# Altium project Owens Test Node.PrjPcb
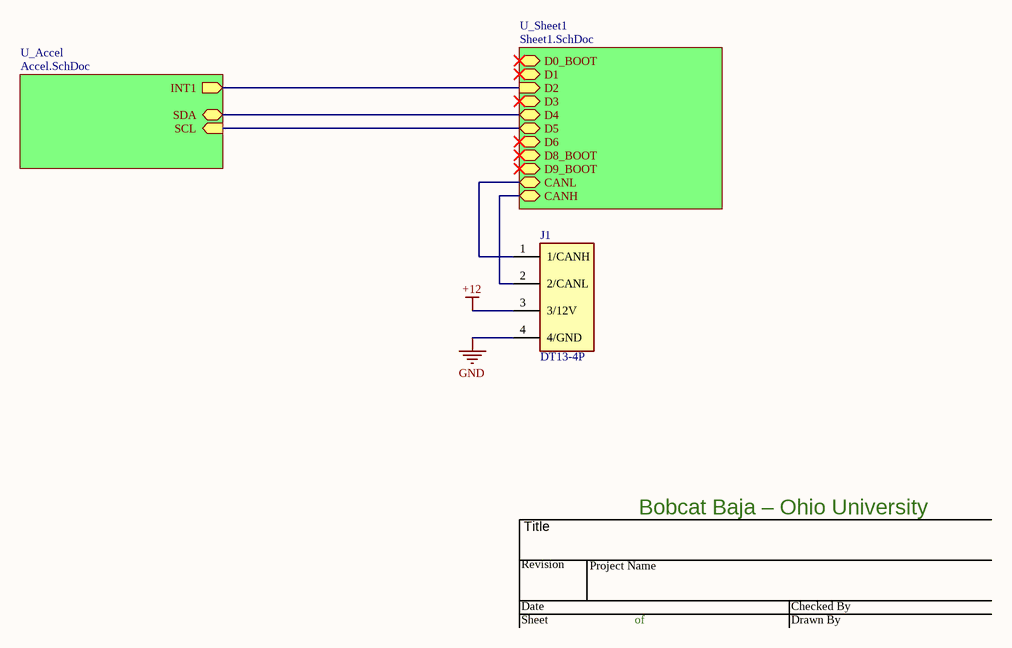
[diagram p0: Owens Test Node.SchDoc]
Title: Owens Test Accelerometer; Revision: A; DrawnBy: Owen Kennedy; CheckedBy: Toph Jones
3 sheets, 21 parts. Net scope: hierarchical (ports join the sheet entries above them; power ports are global).
Board file: Owens Test Node.PcbDoc
Sheets:
  Owens Test Node.SchDoc
    U_Accel = Accel.SchDoc
    U_Sheet1 = Sheet1.SchDoc

## Sheet Owens Test Node.SchDoc: Owens Test Accelerometer
size A; SheetNumber: 1; SheetTotal: 3

### Parts
J1  DT13-4P  [TE_DT13-4P]

### Sub-sheets
U_Accel = Accel.SchDoc: INT1 (out), SDA (bidir), SCL (in)
U_Sheet1 = Sheet1.SchDoc: D0_BOOT (bidir), D1 (bidir), D2 (in), D3 (bidir), D4 (bidir), D5 (bidir), D6 (bidir), D8_BOOT (bidir), D9_BOOT (bidir), CANL (bidir), CANH (bidir)

### Nets
+12: J1.3(3/12V)
GND: J1.4(4/GND)
CANH: J1.2(2/CANL) ; sheet U_Sheet1/CANH
CANL: J1.1(1/CANH) ; sheet U_Sheet1/CANL
SCL: sheet U_Accel/SCL, sheet U_Sheet1/D5
SDA: sheet U_Accel/SDA, sheet U_Sheet1/D4
NetU3_3: sheet U_Accel/INT1, sheet U_Sheet1/D2

### Notes on the sheet
- Title
- Bobcat Baja – Ohio University
- Revision
- Date
- Project Name
- Checked By
- Sheet
- of
- Drawn By

### Library data of the parts
J1 = CMP-002-00095-3: DT13 Series 4.44mm Pitch 4 Way 2 Row Right Angle PCB Header Solder Termination; MF: TE Connectivity; Design Item ID: DT13-4P; EU_RoHS_Compliance: Compliant; SnapEDA_Link: https://www.snapeda.com/parts/DT13-4P/TE+Connectivity+%252F+DEUTSCH/view-part/?ref=snap; Check_prices: https://www.snapeda.com/parts/DT13-4P/TE+Connectivity+%252F+DEUTSCH/view-part/?ref=eda; Component Type: Standard; MP: DT13-4P; Pins: 4; Source: DT13-4P.SchLib; Case/Package: None; Value: *

## Sheet Accel.SchDoc: Owens Test Accelerometer
size A; SheetNumber: 3; SheetTotal: 3
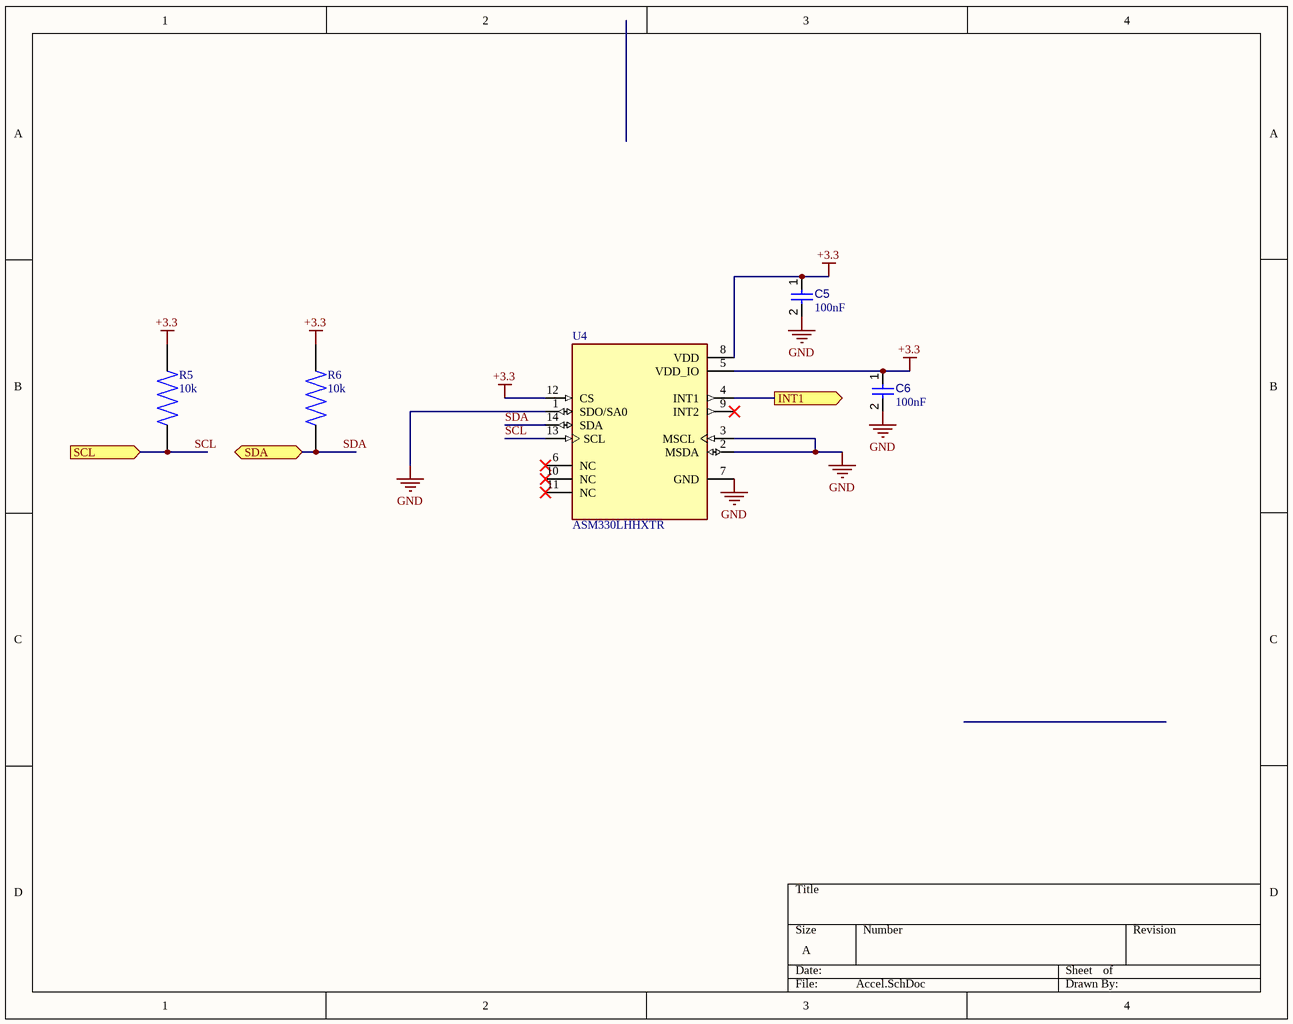
[diagram p1: Accel.SchDoc]

### Parts
C5  value 100nF  [KEMT-1206-2_L]  (hidden comment: C1206C104K5RACTU)
C6  value 100nF  [KEMT-1206-2_L]  (hidden comment: C1206C104K5RACTU)
R5  value 10k  [RESC3116X65N]  (hidden comment: RCS120610K0FKEA)
R6  value 10k  [RESC3116X65N]  (hidden comment: RCS120610K0FKEA)
U4  ASM330LHHXTR  [XDCR_ASM330LHHXTR]

### Ports
INT1 (out), SCL (in), SDA (bidir)

### Nets
+3.3: C5.1 C6.1 R5.2 R6.2 U4.5(VDD_IO) U4.8(VDD) U4.12(CS)
GND: C5.2 C6.2 U4.1(SDO/SA0) U4.2(MSDA) U4.3(MSCL) U4.7(GND)
SCL: R5.1 U4.13(SCL) ; port SCL
SDA: R6.1 U4.14(SDA) ; port SDA
NetU3_3: U4.4(INT1) ; port INT1

Not connected (* = marked no-connect by the designer): U4 6(NC)* 9(INT2)* 10(NC)* 11(NC)*

### Library data of the parts
C5 C6 = CMP-001-00131-1: Multilayer Ceramic Capacitors MLCC – SMD/SMT; KEMET; C1206C104K5RACTU; 100 nF; 1206; 50 V; 50 V; Tolerance: 10%; Voltage Rating: 50V; Case/Package: 1206; Max Operating Temperature: 125°C; Min Operating Temperature: -55°C; Pins: 2; Mounting Technology: Surface Mount
R5 R6 = CMP-009-00195-1: 10 kOhms Â±1% 0.5W, 1/2W Chip Resistor 1206 (3216 Metric) Automotive AEC-Q200, Pulse Withstanding Thick Film; MF: Vishay Dale; Design Item ID: RCS120610K0FKEA; Case/Package: 3116 Vishay; Check_prices: https://www.snapeda.com/parts/RCS120610K0FKEA/Vishay+Dale/view-part/?ref=eda; Source: RCS120610K0FKEA.SchLib; Pins: 2; MP: RCS120610K0FKEA; Component Type: Standard; SnapEDA_Link: https://www.snapeda.com/parts/RCS120610K0FKEA/Vishay+Dale/view-part/?ref=snap
U4 = CMP-522-000000-1: Accelerometer, Gyroscope, Temperature, 6 Axis Sensor IÂ²C, I3Câ„ , SPI Output; MF: STMicroelectronics; Source: ASM330LHHXTR.SchLib; Component Type: Standard; SnapEDA_Link: https://www.snapeda.com/parts/ASM330LHHXTR/STMicroelectronics/view-part/?ref=snap; Package: VFLGA-14 STMicroelectronics; Value: *; Pin Count: 14; Design Item ID: ASM330LHHXTR; MP: ASM330LHHXTR; Check_prices: https://www.snapeda.com/parts/ASM330LHHXTR/STMicroelectronics/view-part/?ref=eda

## Sheet Sheet1.SchDoc: Owens Test Accelerometer
size A; SheetNumber: 2; SheetTotal: 3
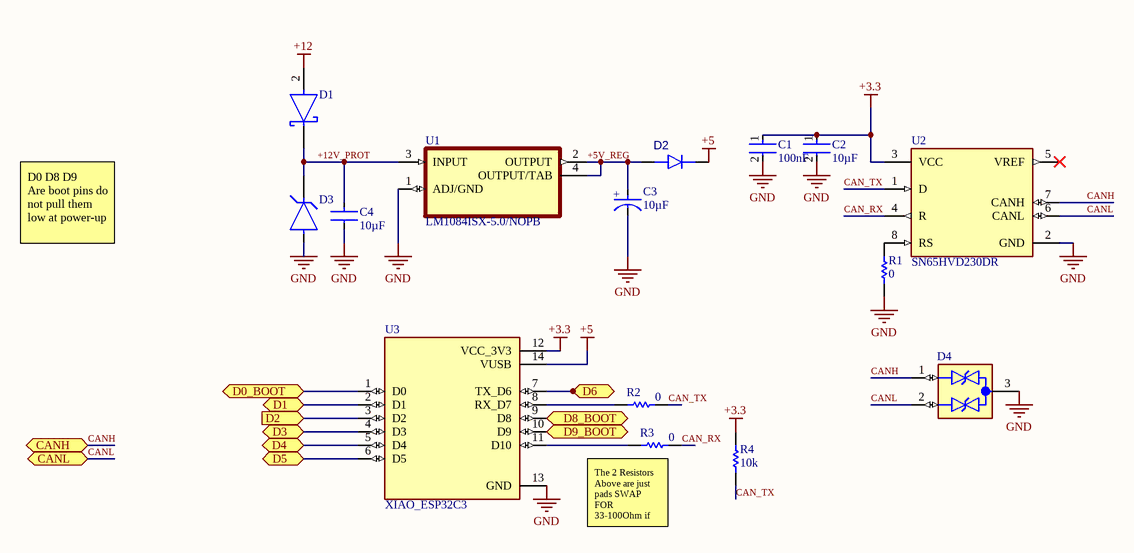
[diagram p2: Sheet1.SchDoc]

### Parts
C1  value 100nF  [FP-C0805C-DN-IPC_A]  (hidden comment: C0805C104K5RACTU)
C2  value 10µF  [FP-CGA4J-IPC_A]  (hidden comment: CGA4J1X7S1E106K125AE)
C3  value 10µF  [FP-T491A106K016AT-MFG]  (hidden comment: T491A106K016AT)
C4  value 10µF  [FP-CGA4J-IPC_A]  (hidden comment: CGA4J1X7S1E106K125AE)
D1  B340A-13-F  [FP-SMA-MFG]  (value not drawn)
D2  1N5819HW-7-F  [FP-SOD123-IPC_C]  (value not drawn)
D3  SMBJ15A  [FP-SMBJ-MFG]  (value not drawn)
D4  ESD2CAN24DBZRQ1  [SOT95P237X112-3N]  (value not drawn)
R1  value 0  [RESC2013X60X35ML10T20]  (hidden comment: Resistor 0R +/- 5% 0805 125 mW)
R2  value 0  [RESC2013X60X35ML10T20]  (hidden comment: Resistor 0R +/- 5% 0805 125 mW)
R3  value 0  [RESC2013X60X35ML10T20]  (hidden comment: Resistor 0R +/- 5% 0805 125 mW)
R4  value 10k  [RESC2013X60X35LL10T20]  (hidden comment: RC0805FR-0710KL)
U1  LM1084ISX-5.0/NOPB  [TO254P1524X483-4N]
U2  SN65HVD230DR  [FP-D0008A-IPC_B]
U3  XIAO_ESP32C3  [MODULE_XIAO_ESP32C3]

### Ports
CANH (bidir), CANL (bidir), D0_BOOT (bidir), D1 (bidir), D2 (in), D3 (bidir), D4 (bidir), D5 (bidir), D6 (bidir), D8_BOOT (bidir), D9_BOOT (bidir)

### Nets
+3.3: C1.1 C2.1 R4.2 U2.3(VCC) U3.12(VCC_3V3)
+5: D2.1(K) U3.14(VUSB)
+12: D1.2(A)
GND: C1.2 C2.2 C3.1(C) C4.2 D3.2(A) D4.3(GND) R1.1 U1.1(ADJ/GND) U2.2(GND) U3.13(GND)
+5V_REG: C3.2(A) D2.2(A) U1.2(OUTPUT) U1.4(OUTPUT/TAB)
+12V_PROT: C4.1 D1.1(C) D3.1(C) U1.3(INPUT)
CAN_RX: R3.2 U2.4(R)
CAN_TX: R2.2 R4.1 U2.1(D)
CANH: D4.1(IO1) U2.7(CANH) ; port CANH
CANL: D4.2(IO2) U2.6(CANL) ; port CANL
SCL: U3.6(D5) ; port D5
SDA: U3.5(D4) ; port D4
NetR1_2: R1.2 U2.8(RS)
NetR2_1: R2.1 U3.8(RX_D7)
NetR3_1: R3.1 U3.11(D10)
NetU3_1: U3.1(D0) ; port D0_BOOT
NetU3_2: U3.2(D1) ; port D1
NetU3_3: U3.3(D2) ; port D2
NetU3_4: U3.4(D3) ; port D3
NetU3_7: U3.7(TX_D6) ; port D6
NetU3_9: U3.9(D8) ; port D8_BOOT
NetU3_10: U3.10(D9) ; port D9_BOOT

Not connected (* = marked no-connect by the designer): U2 5(VREF)*

### Notes on the sheet
- D0 D8 D9
  Are boot pins do not pull them low at power-up
- (near R3) The 2 Resistors Above are just pads SWAP FOR 33-100Ohm if car is noisy
- (in symbol CMP-001-00127-1) +

### Library data of the parts
C1 = CMP-001-00126-1: 50V 100nF X7R ±10% 0805 Multilayer Ceramic Capacitors MLCC - SMD/SMT ROHS; Pins: 2; Tolerance: 10%; Case/Package: 0805; Max Operating Temperature: 125°C; Min Operating Temperature: -55°C; Voltage Rating: 50V; Mounting Technology: Surface Mount
C2 C4 = CMP-001-00125-1: 25V 10uF X7S 卤10% 0805 Multilayer Ceramic Capacitors MLCC - SMD/SMT ROHS; Tolerance: 10%; Case/Package: 0805; Mounting Technology: Surface Mount; Min Operating Temperature: -55°C; Max Operating Temperature: 125°C; Voltage Rating: 25V
C3 = CMP-001-00127-1: Cap Tant Solid 10uF 16V A CASE 10% (3.2 X 1.6 X 1.6mm) Inward L SMD 3216-18 3 Ohm 125C T/R; Ripple Current: 63mA; Mounting Technology: Surface Mount; Min Operating Temperature: -55°C; Max Operating Temperature: 125°C; Case/Package: 1206; Voltage Rating: 16V; Pins: 2; Tolerance: 10%
D1 = CMP-004-00039-1: Rectifier Diode, Schottky, 1 Phase, 1 Element, 3A, 40V V(RRM), Silicon, DO-214AC; Forward Voltage: 500mV; Case/Package: SMA; Mounting Technology: Surface Mount; Min Operating Temperature: -55°C; Pins: 2; Forward Current: 3A; Max Operating Temperature: 150°C
D2 = CMP-004-00040-1: 1N5819HW Series 40 V 1 A Surface Mount Schottky Barrier Rectifier - SOD-123; Forward Voltage: 750mV; Forward Current: 1A; Pins: 2; Case/Package: SOD-123-2; Max Operating Temperature: 125°C; Min Operating Temperature: -65°C
D3 = CMP-004-00044-1: TVS Diode, SMBJ, Unidirectional, 15 V, 24.4 V, DO-214AA (SMB), 2 Pins; Max Surge Current: 100A; Pins: 2; Mounting Technology: Surface Mount; Max Operating Temperature: 150°C; Min Operating Temperature: -55°C; Case/Package: SMB
D4 = CMP-004-00043-1: Automotive, dual, 3-pF, ±24-V, ±30-kV ESD protection diode for in-vehicle networks; MF: Texas Instruments; Source: ESD2CAN24DBZRQ1.SchLib; Value: *; MP: ESD2CAN24DBZRQ1; SnapEDA_Link: https://www.snapeda.com/parts/ESD2CAN24DBZRQ1/Texas+Instruments/view-part/?ref=snap; Case/Package: SOT-23 Texas Instruments; Pins: 3; Check_prices: https://www.snapeda.com/parts/ESD2CAN24DBZRQ1/Texas+Instruments/view-part/?ref=eda; Component Type: Standard; Design Item ID: ESD2CAN24DBZRQ1
R1-R3 = CMP-009-00007-5: Chip Resistor, 0 Ohm, 0.125 W, -55 to 155 degC, 0805 (2012 Metric); Power: 125mW; Voltage Rating: 50V; RoHS Compliant: True; Max Operating Temperature: 155°C; Case/Package: 0805; Mounting Technology: SM; Min Operating Temperature: -55°C; Tolerance: 5%; Pins: 2
R4 = CMP-009-00200-1: 10 kOhms ¡À1% 0.125W, 1/8W Chip Resistor 0805 (2012 Metric) Moisture Resistant Thick Film; Voltage Rating: 150V; Tolerance: 1%; Case/Package: 0805; Mounting Technology: Surface Mount; Max Operating Temperature: 155°C; Min Operating Temperature: -55°C; Pins: 2
U1 = CMP-059-000000-2: 5.5-A, 29-V, linear voltage regulator; MF: Texas Instruments; Component Type: Standard; Package: TO263-3 Texas Instruments; Value: *; Pin Count: 4; Design Item ID: LM1084ISX-5.0/NOPB; MP: LM1084ISX-5.0/NOPB; SnapEDA_Link: https://www.snapeda.com/parts/LM1084ISX-5.0/NOPB/Texas+Instruments/view-part/?ref=snap; Check_prices: https://www.snapeda.com/parts/LM1084ISX-5.0/NOPB/Texas+Instruments/view-part/?ref=eda; Source: LM1084ISX-5.0_NOPB.SchLib
U2 = CMP-014-00002-1: Texas Instruments CANTransceiver, 1Transceiver, Maximum data rate1Mbps, SOICencapsulation, 8Pin; Max Supply Voltage: 3.6V; Min Supply Voltage: 3V; Pins: 8; Min Operating Temperature: -40°C; Case/Package: SOIC; Max Operating Temperature: 85°C
U3 = CMP-504-000000-1: Dev.kit: evaluation; u.FL antenna,prototype board; XIAO; PIN: 2x7; MF: Seeed Studio; MP: XIAO ESP32C3; Source: XIAO_ESP32C3.SchLib; Value: *; Design Item ID: XIAO_ESP32C3; Pin Count: 14; Package: None; Check_prices: https://www.snapeda.com/parts/XIAO%20ESP32C3/Seeed+Studio/view-part/?ref=eda; Component Type: Standard; SnapEDA_Link: https://www.snapeda.com/parts/XIAO%20ESP32C3/Seeed+Studio/view-part/?ref=snap

## Nets that join several sheets
+3.3: Accel (7 pins), Sheet1 (5 pins)
+12: Owens Test Node (J1.3), Sheet1 (D1.2)
GND: Owens Test Node (J1.4), Accel (6 pins), Sheet1 (10 pins)
CANH: Owens Test Node (J1.2), Sheet1 (D4.1 U2.7)
CANL: Owens Test Node (J1.1), Sheet1 (D4.2 U2.6)
NetU3_3: Accel (U4.4), Sheet1 (U3.3)
SCL: Accel (R5.1 U4.13), Sheet1 (U3.6)
SDA: Accel (R6.1 U4.14), Sheet1 (U3.5)